# Altium schematic sheet Motion-Temp-Sensor-Sheet.SchDoc
size 420 x 297 mm; SheetNumber: 6; SheetTotal: 11
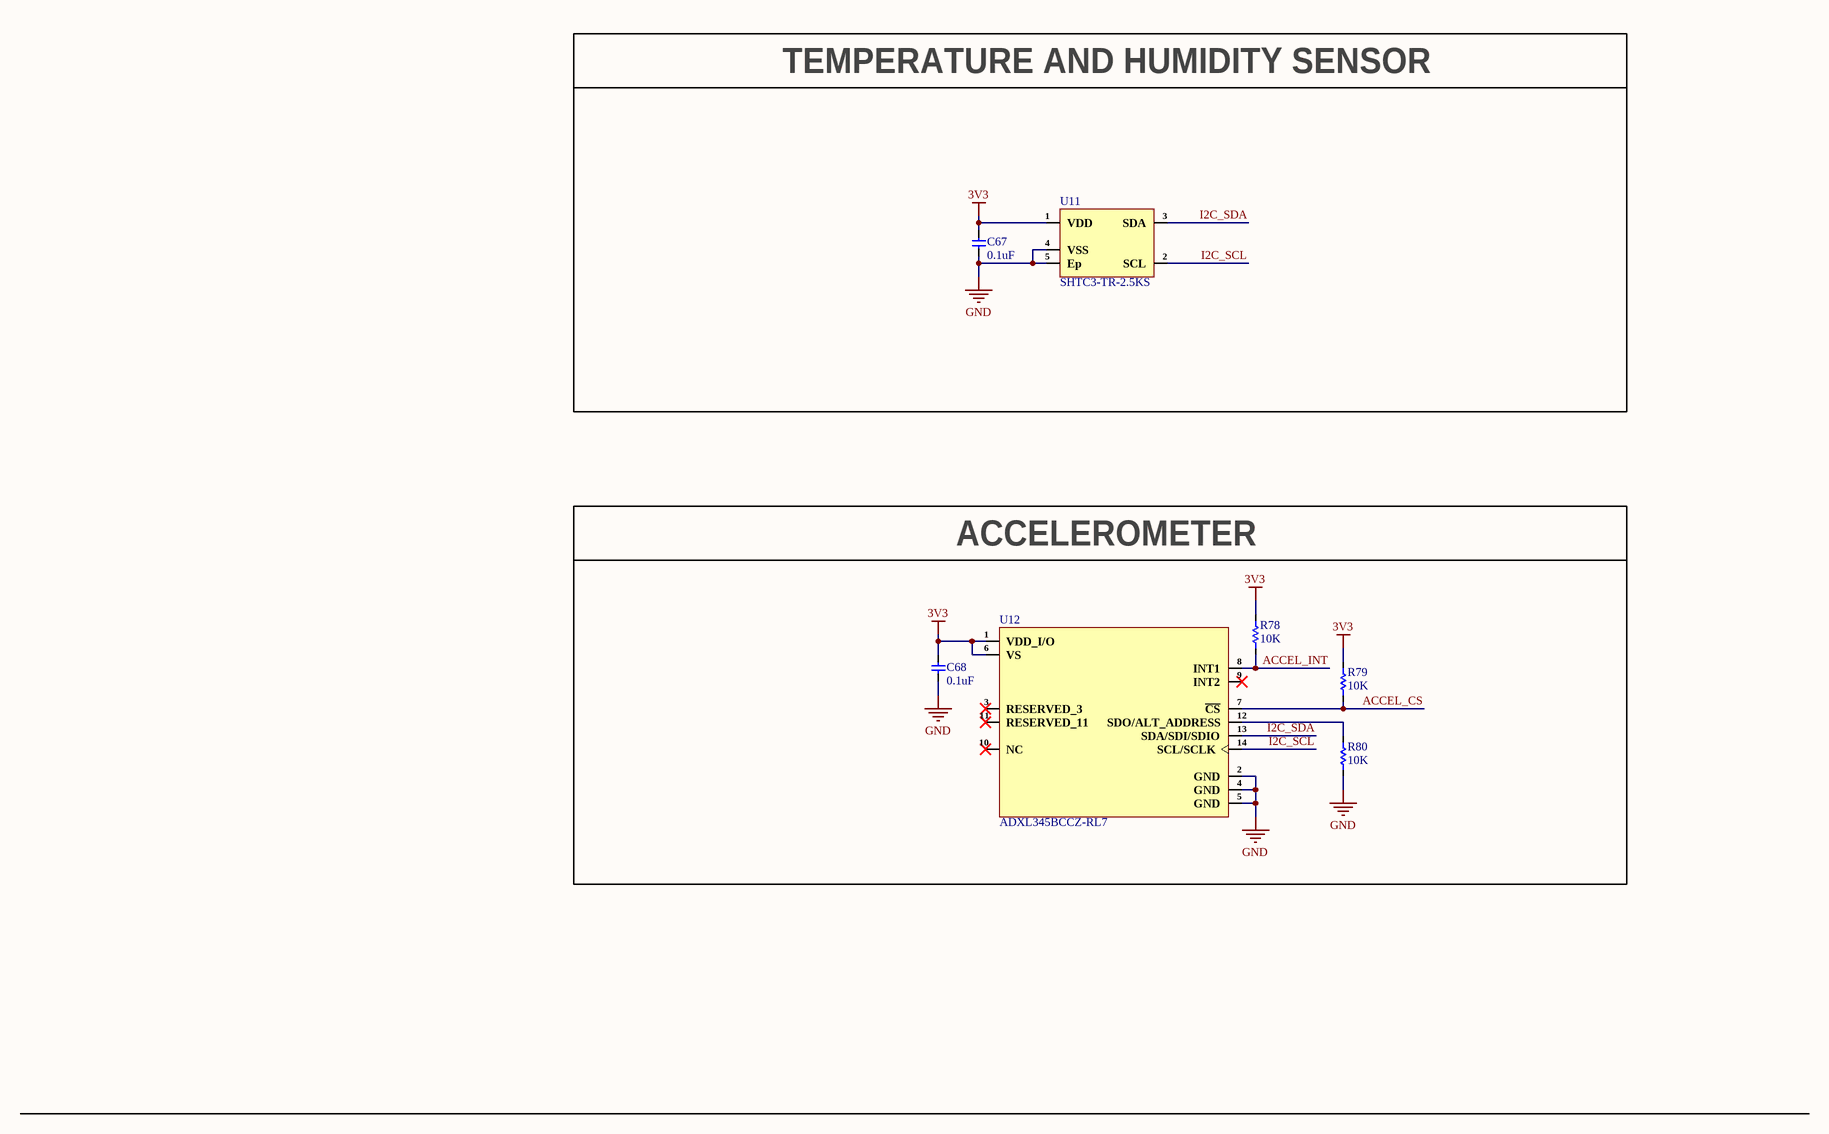
[diagram p0: Motion-Temp-Sensor-Sheet.SchDoc]

## Parts
C67  0.1uF  [Cap-0402]
C68  0.1uF  [Cap-0402]
R78  10K  [Res-0402]
R79  10K  [Res-0402]
R80  10K  [Res-0402]
U11  SHTC3-TR-2.5KS  [4-WDFN Exposed Pad]
U12  ADXL345BCCZ-RL7  [14-LGA (3x5)]

## Blocks framed on the sheet
TEMPERATURE AND HUMIDITY SENSOR: C67 U11
ACCELEROMETER: C68 R78-R80 U12

## Nets
3V3: C67.2 C68.1 R78.2 R79.2 U11.1(VDD) U12.1(VDD_I/O) U12.6(VS)
GND: C67.1 C68.2 R80.1 U11.4(VSS) U11.5(Ep) U12.2(GND) U12.4(GND) U12.5(GND)
ACCEL_CS: R79.1 U12.7(~{CS})
ACCEL_INT: R78.1 U12.8(INT1)
I2C_SCL: U11.2(SCL) U12.14(SCL/SCLK)
I2C_SDA: U11.3(SDA) U12.13(SDA/SDI/SDIO)
NetR80_2: R80.2 U12.12(SDO/ALT_ADDRESS)

Not connected (* = marked no-connect by the designer): U12 3(RESERVED_3)* 9(INT2)* 10(NC)* 11(RESERVED_11)*

## Notes on the sheet
- ZyntelliTech
- File:
- Title:
- Date:
- Page
- Num:
- Total:
- Drawn By: Huzaifa Ali

## Library data of the parts
C67 = CC0402KRX7R7BB104: CAP CER 0.1UF 16V X7R 0402; Manufacturer: Yageo; Item Type: Capacitors; Material: 4241ConductorMaterial; Tolerance: 10%; Value: 100nF; Temperature Coefficient: 30ppm/°C; Supplier: Future Electronics; LCSC Part Number: C60474; Manufacturer Part Number: CC0402KRX7R7BB104; RoHS: Yes; Stock: 22130000; Pricing: 10000=0.0021, 40000=0.002, 150000=0.0019, 250000=0.0019, 500000=0.0018 (USD); Mounting Technology: Surface Mount; Case/Package: 0402; Pins: 2; Case Code (Metric): 1005; Case Code (Imperial): 0402; Min Operating Temperature: -55°C; Max Operating Temperature: 125°C; Dielectric: X7R; Voltage Rating: 16V; Voltage Rating (DC): 16V; Packaging: Tape and Reel; Package Quantity: 1; Termination: SMD/SMT; Voltage: 16V; Series: CC; Voltage Rating (AC): 16V; Length: 1mm; Width: 0.02inch; Height: 0.5mm; Thickness: 0.022inch; Depth: 0.5mm; Radiation Hardening: No; RoHS Compliant: Yes; Reach SVHC Compliant: No; Halogen Free: 5694HalogenFree; Lead Free: 5697LeadFree; ComponentLink1URL: https://datasheet.ciiva.com/11788/0900766b80ce67ed-11788364.pdf?src-supplier=Rs; ComponentLink1Description: https://datasheet.ciiva.com/11788/0900766b80ce67ed-11788364.pdf?src-supplier=Rs; ComponentLink2URL: https://datasheet.ciiva.com/7978/1489800-7978111.pdf?src-supplier=Element14; ComponentLink2Description: https://datasheet.ciiva.com/7978/1489800-7978111.pdf?src-supplier=Element14; ComponentLink3URL: https://datasheet.ciiva.com/161/mlccorderingcode-161545.pdf?src-supplier=Digikey; ComponentLink3Description: https://datasheet.ciiva.com/161/mlccorderingcode-161545.pdf?src-supplier=Digikey; ComponentLink4URL: https://datasheet.ciiva.com/161/mlccorderingcode-161544.pdf?src-supplier=Digikey; ComponentLink4Description: https://datasheet.ciiva.com/161/mlccorderingcode-161544.pdf?src-supplier=Digikey; ComponentLink5URL: https://datasheet.ciiva.com/161/mlccorderingcode-161546.pdf?src-supplier=Digikey; ComponentLink5Description: https://datasheet.ciiva.com/161/mlccorderingcode-161546.pdf?src-supplier=Digikey; ComponentLink6URL: https://datasheet.ciiva.com/8033/1734573-8033661.pdf?src-supplier=Element14; ComponentLink6Description: https://datasheet.ciiva.com/8033/1734573-8033661.pdf?src-supplier=Element14; ComponentLink7URL: https://datasheet.ciiva.com/28450/1489800-28450335.pdf?src-supplier=Element14; ComponentLink7Description: https://datasheet.ciiva.com/28450/1489800-28450335.pdf?src-supplier=Element14; ComponentLink8URL: https://datasheet.ciiva.com/13395/upy-gphc-x7r-6-3v-to-50v-8-13395676.pdf?src-supplier=Mouser; ComponentLink8Description: https://datasheet.ciiva.com/13395/upy-gphc-x7r-6-3v-to-50v-8-13395676.pdf?src-supplier=Mouser; ComponentLink9URL: https://datasheet.ciiva.com/8033/1734573-8033663.pdf?src-supplier=Element14; ComponentLink9Description: https://datasheet.ciiva.com/8033/1734573-8033663.pdf?src-supplier=Element14; ComponentLink10URL: https://datasheet.ciiva.com/11587/upy-gphc-x7r-6-3v-to-50v-8-11587305.pdf?src-supplier=Avnet; ComponentLink10Description: https://datasheet.ciiva.com/11587/upy-gphc-x7r-6-3v-to-50v-8-11587305.pdf?src-supplier=Avnet
C68 = CC0402JRX7R7BB104: CAP CER 0.1UF 16V X7R 0402; Manufacturer: Yageo; Material: 4241ConductorMaterial; Value: 100nF; Tolerance: 5%; Item Type: Capacitor; Supplier: Digikey; Supplier Part Number: 311-1676-1-ND; Manufacturer Part Number: CC0402JRX7R7BB104; RoHS: Yes; Category: Ceramic Capacitors; Stock: 1659111; Pricing: 1=0.1, 10=0.046, 50=0.0262, 100=0.0203, 500=0.01528, 1000=0.012, 2500=0.01091, 5000=0.01004 (USD); Mounting Technology: Surface Mount; Case/Package: 0402; Case Code (Metric): 1005; Case Code (Imperial): 0402; Min Operating Temperature: -55°C; Max Operating Temperature: 125°C; Dielectric: X7R; Packaging: Tape and Reel; Package Quantity: 10000; Voltage Rating (DC): 16V; Voltage Rating: 16V; Series: CC; Construction: Flat; Length: 0.039inch; Width: 0.02inch; Height: 0.5mm; Thickness: 0.022inch; Lead Free: Lead Free; Halogen Free: Halogen Free; RoHS Compliant: Yes; ComponentLink1URL: https://datasheet.ciiva.com/13210/upy-gphc-x7r-6-3v-to-50v-8-12304-13210152.pdf?src-supplier=Mouser; ComponentLink1Description: https://datasheet.ciiva.com/13210/upy-gphc-x7r-6-3v-to-50v-8-12304-13210152.pdf?src-supplier=Mouser; LCSC Part Number: C541464
R78-R80 = RC0402FR-0710KL: RES 10K OHM 1% 1/16W 0402; Manufacturer: Yageo; Resistance: 10kR; Voltage Rating (DC): 50V; Temperature Coefficient: 100ppm/°C; Power Rating: 62.5mW; Max Power Dissipation: 63mW; Item Type: Resistor; Supplier 1: Mouser; Manufacturer Part Number: RC0402FR-0710KL; RoHS: Yes; Category: Chip SMD Resistors; Stock 1: 18648329; Pricing 1: 1=0.10000, 10=0.01400, 50=0.01400, 100=0.00500, 1000=0.00300, 10000=0.00200 (USD); Case/Package: 0402; Number of Pins: 2; Case Code (Imperial): 0402; Case Code (Metric): 1005; Min Operating Temperature: -55°C; Max Operating Temperature: 155°C; Resistor Type: Thick Film; Tolerance: 1%; Packaging: Tape and Reel; Voltage Rating: 50V; Termination: SMD/SMT; Working Voltage: 50V; Number of Terminations: 2; Features: Moisture Resistant; Series: RC; Resistance Tolerance: 1%; Construction: Rectangular; Length: 1mm; Width: 0.5mm; Height: 0.32mm; Depth: 0.5mm; Lead Pitch: 0.2mm; REACH SVHC: No SVHC; Lead Free: Lead Free; RoHS Compliant: Yes; Military Standard: Not; ComponentLink1URL: https://datasheet.ciiva.com/7660/38568-7660787.pdf?src-supplier=Element14; ComponentLink1Description: https://datasheet.ciiva.com/7660/38568-7660787.pdf?src-supplier=Element14; ComponentLink2URL: https://datasheet.ciiva.com/7849/1686128-7849814.pdf?src-supplier=Element14; ComponentLink2Description: https://datasheet.ciiva.com/7849/1686128-7849814.pdf?src-supplier=Element14; ComponentLink3URL: https://datasheet.ciiva.com/7983/1018594-7983486.pdf?src-supplier=Element14; ComponentLink3Description: https://datasheet.ciiva.com/7983/1018594-7983486.pdf?src-supplier=Element14; ComponentLink4URL: https://datasheet.ciiva.com/22747/1018594-22747512.pdf?src-supplier=Element14; ComponentLink4Description: https://datasheet.ciiva.com/22747/1018594-22747512.pdf?src-supplier=Element14; ComponentLink5URL: https://datasheet.ciiva.com/12667/pyu-rc0402-51-rohs-l-6-r-12667067.pdf?src-supplier=Mouser; ComponentLink5Description: https://datasheet.ciiva.com/12667/pyu-rc0402-51-rohs-l-6-r-12667067.pdf?src-supplier=Mouser; ComponentLink6URL: https://datasheet.ciiva.com/7849/1784430-7849813.pdf?src-supplier=Element14; ComponentLink6Description: https://datasheet.ciiva.com/7849/1784430-7849813.pdf?src-supplier=Element14; ComponentLink7URL: https://datasheet.ciiva.com/7849/1784430-7849815.pdf?src-supplier=Element14; ComponentLink7Description: https://datasheet.ciiva.com/7849/1784430-7849815.pdf?src-supplier=Element14; Supplier Part Number 1: 603-RC0402FR-0710KL; LCSC Part Number: C60490
U11 = SHTC3-TR-2.5KS: SHTC3 Series Digital ±2% RH SMT Humidity Temperature Sensor - DFN-8; Manufacturer: Sensirion; Item Type: IC; Supplier: Digikey; LCSC Part Number: C194656; Manufacturer Part Number: SHTC3-TR-2.5KS; RoHS: No; Stock: 21685; Pricing: 1=2.72, 5=2.292, 10=2.129, 25=1.932, 50=1.7952, 100=1.6682, 500=1.40712, 1000=1.30776 (USD); ComponentLink1URL: https://datasheet.octopart.com/SHTC3-TR-2.5KS-Sensirion-datasheet-166628637.pdf?src-supplier=Future+Electronics; ComponentLink1Description: https://datasheet.octopart.com/SHTC3-TR-2.5KS-Sensirion-datasheet-166628637.pdf?src-supplier=Future+Electronics
U12 = ADXL345BCCZ-RL7: ACCEL 2-16G I2C/SPI 14LGA; Manufacturer: Analog Devices; Item Type: Accelerometers; Supplier: Mouser; LCSC Part Number: C9667; Manufacturer Part Number: ADXL345BCCZ-RL7; RoHS: Yes; Stock: 17836; Pricing: 1=6.67, 10=5.76, 50=5.27, 100=5.09, 1000=4.59, 10000=4.59 (USD); ComponentLink1URL: https://datasheet.ciiva.com/15099/getdatasheetpartid-317342-15099703.pdf?src-supplier=Verical; ComponentLink1Description: https://datasheet.ciiva.com/15099/getdatasheetpartid-317342-15099703.pdf?src-supplier=Verical; ComponentLink2URL: https://datasheet.ciiva.com/3271/adxl345-ep-3271528.pdf?src-supplier=Avnet; ComponentLink2Description: https://datasheet.ciiva.com/3271/adxl345-ep-3271528.pdf?src-supplier=Avnet; ComponentLink3URL: https://datasheet.ciiva.com/2809/adxl345-2809853.pdf?src-supplier=Digikey; ComponentLink3Description: https://datasheet.ciiva.com/2809/adxl345-2809853.pdf?src-supplier=Digikey; ComponentLink4URL: https://datasheet.ciiva.com/2809/adxl345-2809854.pdf?src-supplier=Digikey; ComponentLink4Description: https://datasheet.ciiva.com/2809/adxl345-2809854.pdf?src-supplier=Digikey; ComponentLink5URL: https://datasheet.ciiva.com/2809/adxl345-2809855.pdf?src-supplier=Digikey; ComponentLink5Description: https://datasheet.ciiva.com/2809/adxl345-2809855.pdf?src-supplier=Digikey; ComponentLink6URL: https://datasheet.ciiva.com/3271/adxl345-ep-3271595.pdf?src-supplier=Avnet; ComponentLink6Description: https://datasheet.ciiva.com/3271/adxl345-ep-3271595.pdf?src-supplier=Avnet